# Altium schematic sheet HLK-RM08A-KIT-V2.5.schdoc
size A3
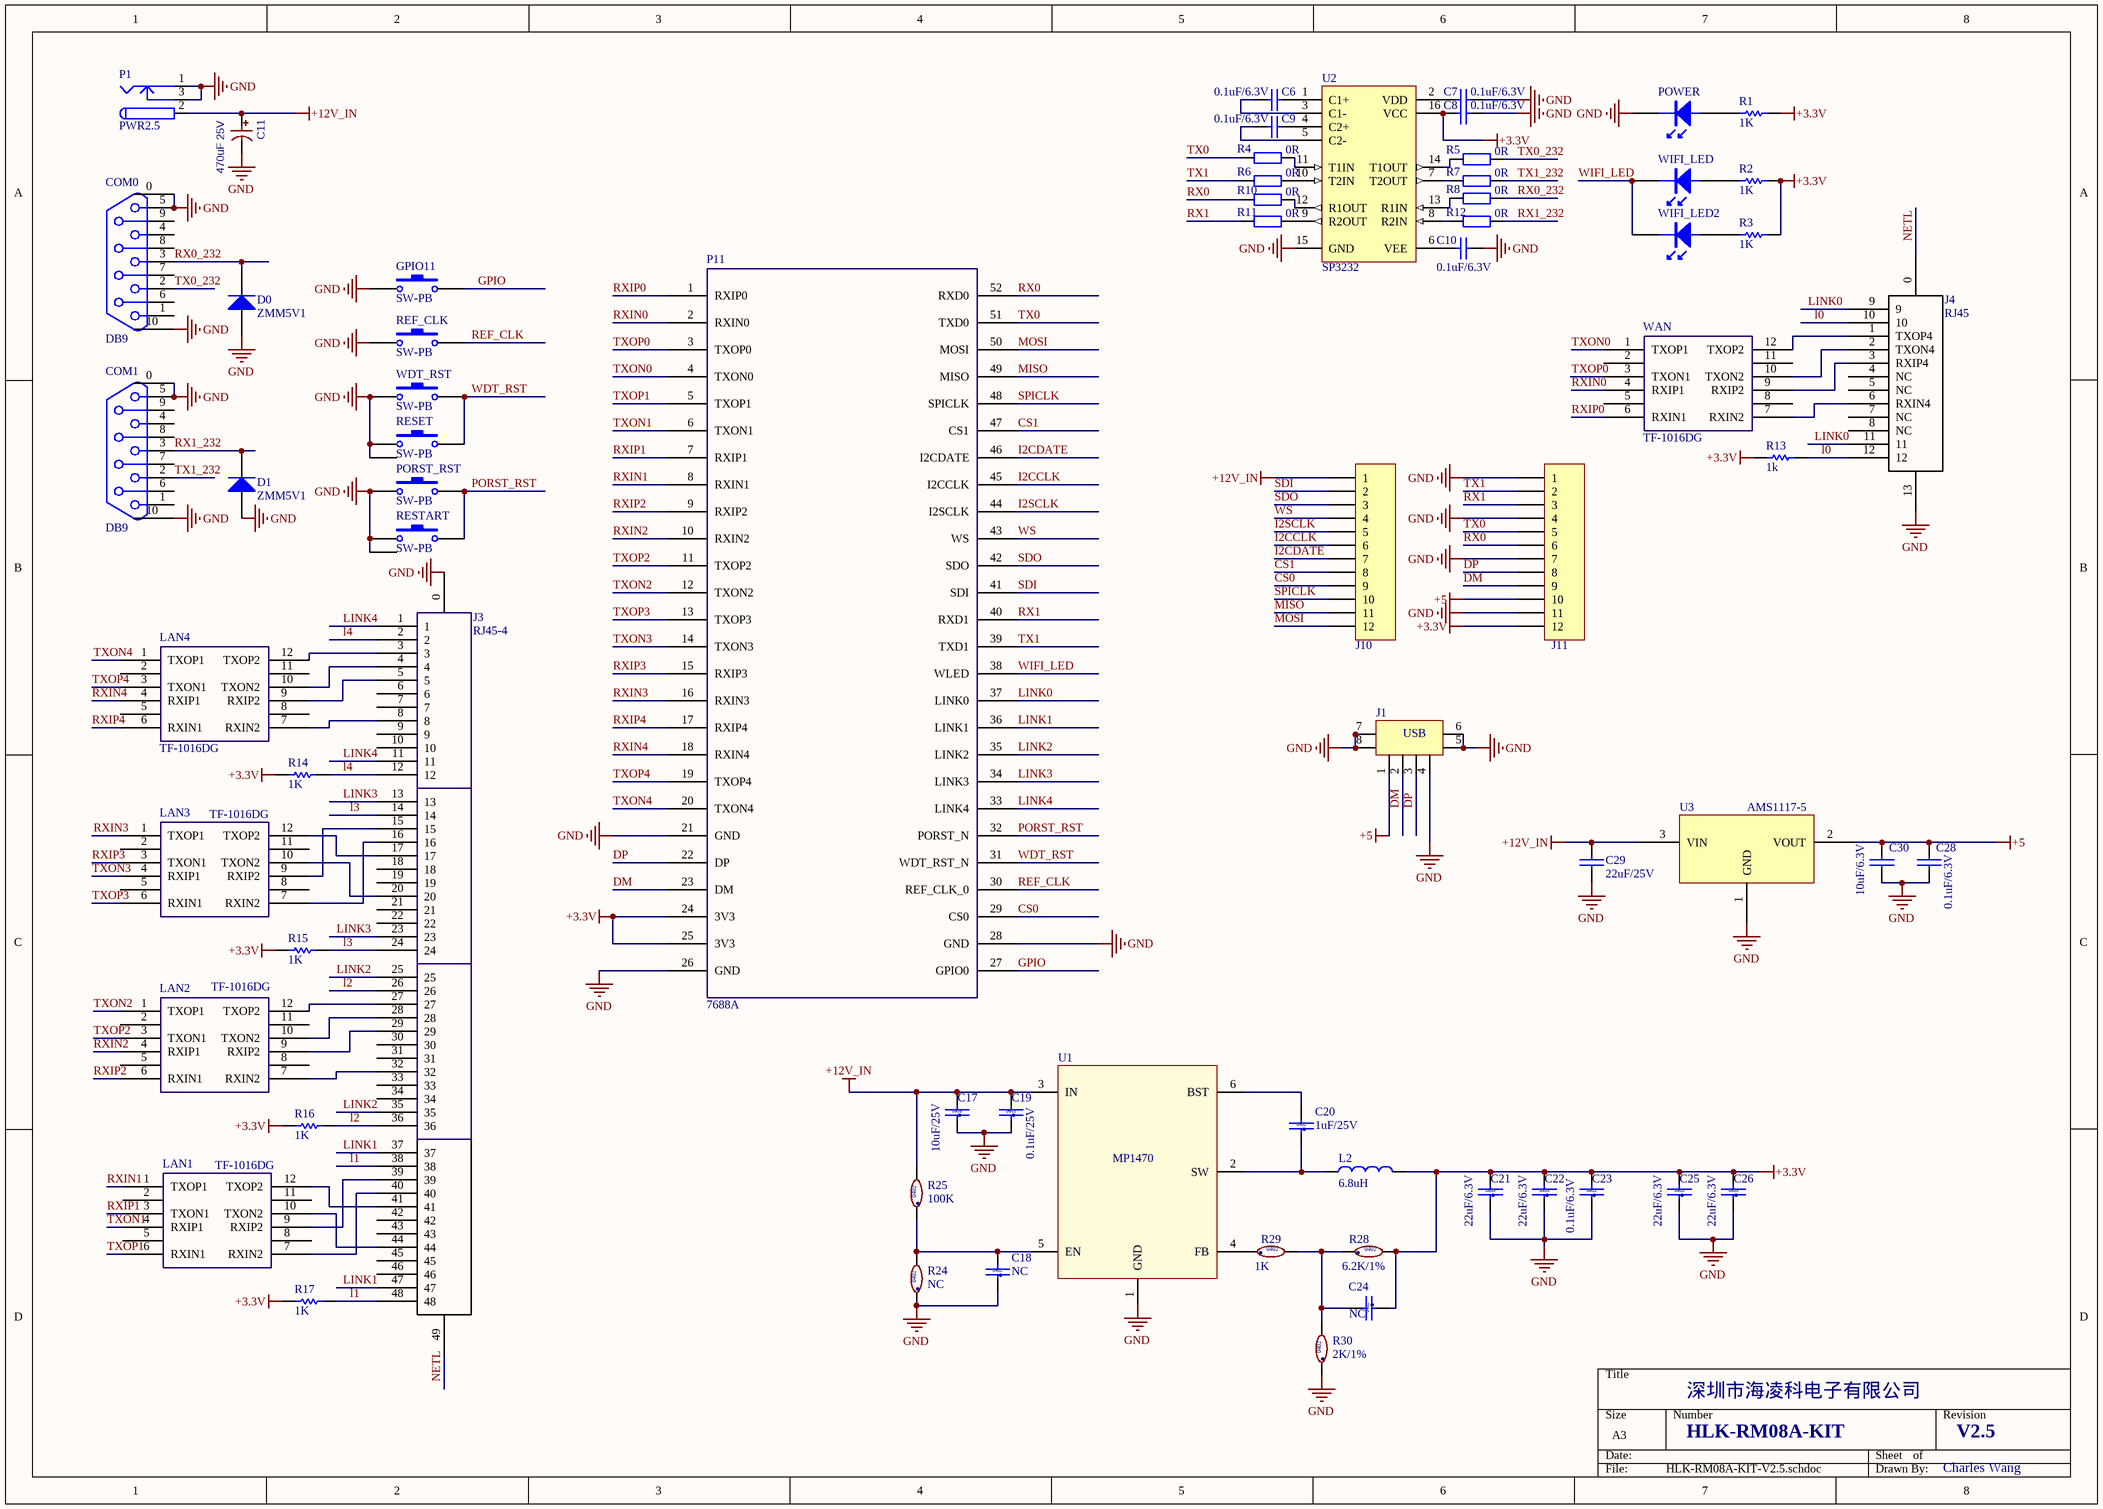
[diagram p0: HLK-RM08A-KIT-V2.5.schdoc]

## Parts
C6  0.1uF/6.3V  [0603]
C7  0.1uF/6.3V  [0603]
C8  0.1uF/6.3V  [0603]
C9  0.1uF/6.3V  [0603]
C10  0.1uF/6.3V  [0603]
C11  470uF 25V  [1000uF 8*12 电解电容]
C17  10uF/25V  [0805]
C18  NC  [0402]
C19  0.1uF/25V  [0603]
C20  1uF/25V  [0402]
C21  22uF/6.3V  [0805]
C22  22uF/6.3V  [0805]
C23  0.1uF/6.3V  [0603]
C24  NC  [0402]
C25  22uF/6.3V  [0805]
C26  22uF/6.3V  [0805]
C28  0.1uF/6.3V  [0603]
C29  22uF/25V  [0603]
C30  10uF/6.3V  [0603]
COM0  DB9  [DB9s]
COM1  DB9  [DB9s]
D0  ZMM5V1  [1005D]
D1  ZMM5V1  [1005D]
GPIO11  SW-PB  [SWITCH]
J1  USB  [USB/4P/P2.0/DIP/R/F/SUA-110VB-B2N]
J3  RJ45-4  [RJ45-4-LED]
J4  RJ45
J10  2.54*16  [HDR1X12]  (value not drawn)
J11  2.54*16  [HDR1X12]  (value not drawn)
L2  6.8uH  [4.7uH SMD,5.8x5.2x4.5mm]
LAN1  TF-1016DG  [tf-1016dg]
LAN2  TF-1016DG  [tf-1016dg]
LAN3  TF-1016DG  [tf-1016dg]
LAN4  TF-1016DG  [tf-1016dg]
P1  PWR2.5  [POWER_STK1]
P11  7688A  [RM08K_52pin]
PORST_RST  SW-PB  [SWITCH]
POWER  (no value)  [0603LED]
R1  1K  [0603]
R2  1K  [0603]
R3  1K  [0603]
R4  0R  [0603]
R5  0R  [0603]
R6  0R  [0603]
R7  0R  [0603]
R8  0R  [0603]
R10  0R  [0603]
R11  0R  [0603]
R12  0R  [0603]
R13  1K  [0603]
R14  1K  [0603]
R15  1K  [0603]
R16  1K  [0603]
R17  1K  [0603]
R24  NC  [0402]
R25  100K  [0402]
R28  6.2K/1%  [0402]
R29  1K  [0402]
R30  2K/1%  [0402]
REF_CLK  SW-PB  [SWITCH]
RESET  SW-PB  [K5]
RESTART  SW-PB  [K5]
U1  MP1470  [MP1470]
U2  SP3232  [MAX3232]
U3  AMS1117-5  [AMS1117]
WAN  TF-1016DG  [tf-1016dg]
WDT_RST  SW-PB  [SWITCH]
WIFI_LED  (no value)  [0603LED]
WIFI_LED2  (no value)  [LED0.2]

## Nets
+3.3V: C8.1 C21.2 C22.2 C23.2 C24.1 C25.2 C26.2 J11.12 L2.2 P11.24(3V3) P11.25(3V3) R1.2 R2.2 R3.2 R13.2 R14.2 R15.2 R16.2 R17.2 R28.2 U2.16(VCC)
+5: C28.1 C30.1 J1.1 J11.10 U3.2(VOUT)
+12V_IN: C11.1 C17.2 C19.2 C29.1 J10.1 P1.2 R25.2 U1.3(IN) U3.3(VIN)
GND: C7.2 C8.2 C10.1 C11.2 C17.1 C18.1 C19.1 C21.1 C22.1 C23.1 C25.1 C26.1 C28.2 C29.2 C30.2 COM0.0 COM0.5 COM0.10 COM1.0 COM1.5 COM1.10 D0.1(A) D1.1(A) GPIO11.1 J1.4 J1.5 J1.6 J1.7 J1.8 J3.0 J4.13 J11.1 J11.4 J11.7 J11.11 P1.1 P1.3 P11.21(GND) P11.26(GND) P11.28(GND) PORST_RST.1 POWER.2 R24.1 R30.1 REF_CLK.1 RESET.1 RESET.3 RESTART.1 RESTART.3 U1.1(GND) U2.15(GND) U3.1(GND) WDT_RST.1
CS0: J10.9 P11.29(CS0)
CS1: J10.8 P11.47(CS1)
DM: J1.2 J11.9 P11.23(DM)
DP: J1.3 J11.8 P11.22(DP)
GPIO: GPIO11.2 P11.27(GPIO0)
I2CCLK: J10.6 P11.45(I2CCLK)
I2CDATE: J10.7 P11.46(I2CDATE)
I2SCLK: J10.5 P11.44(I2SCLK)
l0: J4.10 J4.12 R13.1
l1: J3.38 J3.48 R17.1
l2: J3.26 J3.36 R16.1
l3: J3.14 J3.24 R15.1
l4: J3.2 J3.12 R14.1
LINK0: J4.9 J4.11 P11.37(LINK0)
LINK1: J3.37 J3.47 P11.36(LINK1)
LINK2: J3.25 J3.35 P11.35(LINK2)
LINK3: J3.13 J3.23 P11.34(LINK3)
LINK4: J3.1 J3.11 P11.33(LINK4)
MISO: J10.11 P11.49(MISO)
MOSI: J10.12 P11.50(MOSI)
NETL: J3.49 J4.0
PORST_RST: P11.32(PORST_N) PORST_RST.2 RESTART.2
REF_CLK: P11.30(REF_CLK_0) REF_CLK.2
RX0: J11.6 P11.52(RXD0) R10.1
RX0_232: COM0.3 D0.2(K) R8.2
RX1: J11.3 P11.40(RXD1) R11.1
RX1_232: COM1.3 D1.2(K) R12.2
RXIN0: P11.2(RXIN0) WAN.4(RXIP1)
RXIN1: LAN1.1(TXOP1) P11.8(RXIN1)
RXIN2: LAN2.4(RXIP1) P11.10(RXIN2)
RXIN3: LAN3.1(TXOP1) P11.16(RXIN3)
RXIN4: LAN4.4(RXIP1) P11.18(RXIN4)
RXIP0: P11.1(RXIP0) WAN.6(RXIN1)
RXIP1: LAN1.3(TXON1) P11.7(RXIP1)
RXIP2: LAN2.6(RXIN1) P11.9(RXIP2)
RXIP3: LAN3.3(TXON1) P11.15(RXIP3)
RXIP4: LAN4.6(RXIN1) P11.17(RXIP4)
SDI: J10.2 P11.41(SDI)
SDO: J10.3 P11.42(SDO)
SPICLK: J10.10 P11.48(SPICLK)
TX0: J11.5 P11.51(TXD0) R4.1
TX0_232: COM0.2 R5.2
TX1: J11.2 P11.39(TXD1) R6.1
TX1_232: COM1.2 R7.2
TXON0: P11.4(TXON0) WAN.1(TXOP1)
TXON1: LAN1.4(RXIP1) P11.6(TXON1)
TXON2: LAN2.1(TXOP1) P11.12(TXON2)
TXON3: LAN3.4(RXIP1) P11.14(TXON3)
TXON4: LAN4.1(TXOP1) P11.20(TXON4)
TXOP0: P11.3(TXOP0) WAN.3(TXON1)
TXOP1: LAN1.6(RXIN1) P11.5(TXOP1)
TXOP2: LAN2.3(TXON1) P11.11(TXOP2)
TXOP3: LAN3.6(RXIN1) P11.13(TXOP3)
TXOP4: LAN4.3(TXON1) P11.19(TXOP4)
WDT_RST: P11.31(WDT_RST_N) RESET.2 WDT_RST.2
WIFI_LED: P11.38(WLED) WIFI_LED.2 WIFI_LED2.2
WS: J10.4 P11.43(WS)
NetC6_1: C6.1 U2.3(C1-)
NetC6_2: C6.2 U2.1(C1+)
NetC7_1: C7.1 U2.2(VDD)
NetC9_1: C9.1 U2.5(C2-)
NetC9_2: C9.2 U2.4(C2+)
NetC10_2: C10.2 U2.6(VEE)
NetC18_2: C18.2 R24.2 R25.1 U1.5(EN)
NetC20_1: C20.1 L2.1 U1.2(SW)
NetC20_2: C20.2 U1.6(BST)
NetC24_2: C24.2 R28.1 R29.2 R30.2
NetJ3_3: J3.3 LAN4.12(TXOP2)
NetJ3_4: J3.4 LAN4.10(TXON2)
NetJ3_5: J3.5 LAN4.9(RXIP2)
NetJ3_8: J3.8 LAN4.7(RXIN2)
NetJ3_15: J3.15 LAN3.9(RXIP2)
NetJ3_16: J3.16 LAN3.7(RXIN2)
NetJ3_17: J3.17 LAN3.12(TXOP2)
NetJ3_20: J3.20 LAN3.10(TXON2)
NetJ3_27: J3.27 LAN2.12(TXOP2)
NetJ3_28: J3.28 LAN2.10(TXON2)
NetJ3_29: J3.29 LAN2.9(RXIP2)
NetJ3_32: J3.32 LAN2.7(RXIN2)
NetJ3_39: J3.39 LAN1.9(RXIP2)
NetJ3_40: J3.40 LAN1.7(RXIN2)
NetJ3_41: J3.41 LAN1.12(TXOP2)
NetJ3_44: J3.44 LAN1.10(TXON2)
NetJ4_1: J4.1(TXOP4) WAN.12(TXOP2)
NetJ4_2: J4.2(TXON4) WAN.10(TXON2)
NetJ4_3: J4.3(RXIP4) WAN.9(RXIP2)
NetJ4_6: J4.6(RXIN4) WAN.7(RXIN2)
NetPOWER_1: POWER.1 R1.1
NetR2_1: R2.1 WIFI_LED.1
NetR3_1: R3.1 WIFI_LED2.1
NetR4_2: R4.2 U2.11(T1IN)
NetR5_1: R5.1 U2.14(T1OUT)
NetR6_2: R6.2 U2.10(T2IN)
NetR7_1: R7.1 U2.7(T2OUT)
NetR8_1: R8.1 U2.13(R1IN)
NetR10_2: R10.2 U2.12(R1OUT)
NetR11_2: R11.2 U2.9(R2OUT)
NetR12_1: R12.1 U2.8(R2IN)
NetR29_1: R29.1 U1.4(FB)

Not connected (* = marked no-connect by the designer): COM0 1 4 6 7 8 9; COM1 1 4 6 7 8 9; J3 6 7 9 10 18 19 21 22 30 31 33 34 42 43 45 46; J4 4(NC) 5(NC) 7(NC) 8(NC); LAN1 2 5 8 11; LAN2 2 5 8 11; LAN3 2 5 8 11; LAN4 2 5 8 11; WAN 2 5 8 11

## Notes on the sheet
- 深圳市海凌科电子有限公司
- HLK-RM08A-KIT
- V2.5
- Charles Wang
- (in symbol C0402) 0402; .
- (in symbol C0603) 0603; .
- (in symbol C0805) 0805; .
- (in symbol R0402) 0402; .

## Library data of the parts
C6-C10 = Cap: Capacitor; Value: 100pF; Published: 8-Jun-2000; LatestRevisionDate: 17-Jul-2002; LatestRevisionNote: Re-released for DXP Platform.; PackageReference: RAD-0.3; Publisher: Altium Limited
C11 = 1000uF 8*12 电解电容: BOM_Manufacturer: ValuePro; BOM_Manufacturer Part: 1000uF 10V 8*12; nameAlias: Capacitance; BOM_Supplier: LCSC; BOM_Supplier Part: C10752; spicePre: C; spiceSymbolName: 1000uF 10V 8*12
C17 C21 C22 C25 C26 = C0805
C18 C20 C24 = C0402
C19 C23 = C0603
C28-C30 = CAP: Capacitor
D0 D1 = Diode: Default Diode; Published: 8-Jun-2000; LatestRevisionDate: 17-Jul-2002; LatestRevisionNote: Re-released for DXP Platform.; PackageDocument: Sep-1996; PackageReference: SMC; Publisher: Altium Limited; Code_JEDEC: DO-214-AB
GPIO11 PORST_RST REF_CLK RESET RESTART WDT_RST = SW-PB: Switch; Published: 24-Mar-1999; LatestRevisionDate: 17-Jul-2002; LatestRevisionNote: Re-released for DXP Platform.; PackageReference: SPST-2; Publisher: Altium Limited
J1 = 2
J4 = RJ45_1
J10 J11 = CON16: Connector
L2 = INDUCTOR1
LAN1-LAN4 P11 WAN = Component_1
P1 = PWR2.5: Low Voltage Power Supply Connector
POWER WIFI_LED WIFI_LED2 = LED
R1-R3 R13-R17 = Res1: Resistor; Published: 8-Jun-2000; LatestRevisionDate: 17-Jul-2002; LatestRevisionNote: Re-released for DXP Platform.; PackageReference: AXIAL-0.3; Publisher: Altium Limited
  R1-R3 R14-R17: Value: 1K
  R13: Value: 1k
R4-R8 R10-R12 = Res2: Resistor; Published: 8-Jun-2000; LatestRevisionDate: 17-Jul-2002; LatestRevisionNote: Re-released for DXP Platform.; PackageReference: AXIAL-0.4; Publisher: Altium Limited; Value: 0R
R24 R25 R28-R30 = R0402
U2 = MAX232ACPE: +5V Powered, Multi-Channel RS-232 Driver/Receiver; PackageDocument: 1997; Published: 16-Jan-2001; LatestRevisionDate: 6-Jun-2005; LatestRevisionNote: Stylized 3D Model Added.; PackageReference: PE16A; Publisher: Altium Limited; Code_JEDEC: MS-001-BB; ComponentLink1Description: Manufacturer Link; ComponentLink1URL: http://www.maxim-ic.com/; ComponentLink2Description: Datasheet; ComponentLink2URL: http://pdfserv.maxim-ic.com/en/ds/MAX220-MAX249.pdf
U3 = AMS1117-3.3